# Altium schematic sheet Bank223.SchDoc: Bank223
size A3; Organization: Altium Limited; Address1: L3, 12a Rodborough Rd; Address2: Frenchs Forest; Address3: NSW; Address4: Australia 2086
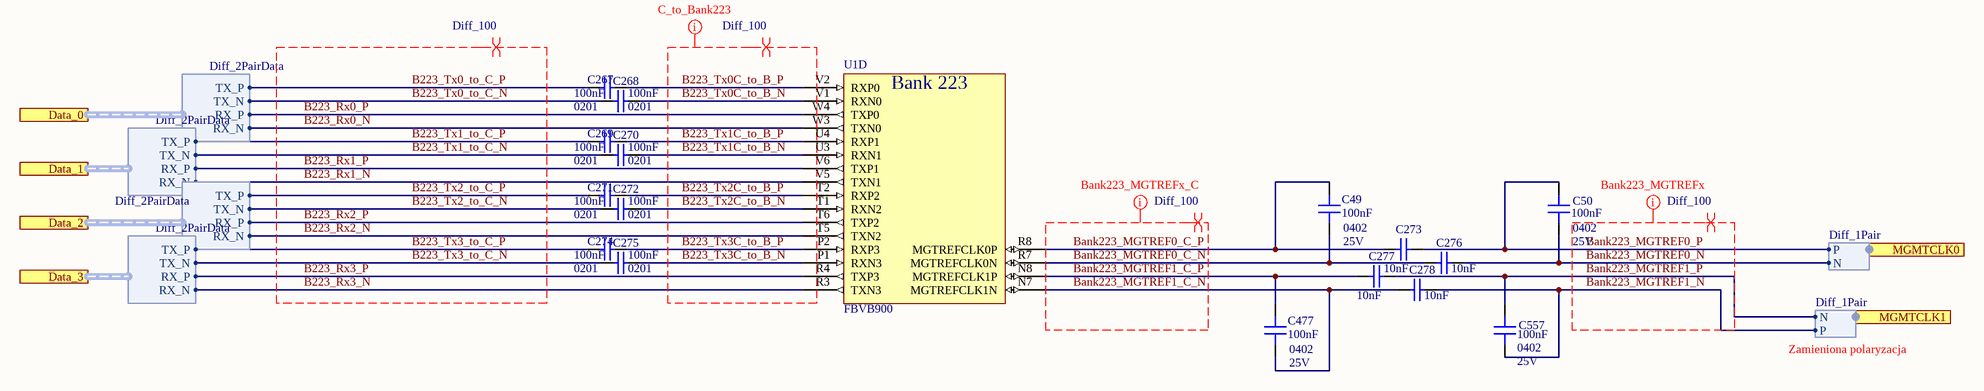
[diagram p0: Bank223.SchDoc]

## Parts
C49  100nF  Case/Package: 0402  Voltage Rating: 25V  [CAP 0402/1005 KK]
C50  100nF  Case/Package: 0402  Voltage Rating: 25V  [CAP 0402/1005 KK]
C267  100nF  Case/Package: 0201  [CAP 0201/0603 KK]
C268  100nF  Case/Package: 0201  [CAP 0201/0603 KK]
C269  100nF  Case/Package: 0201  [CAP 0201/0603 KK]
C270  100nF  Case/Package: 0201  [CAP 0201/0603 KK]
C271  100nF  Case/Package: 0201  [CAP 0201/0603 KK]
C272  100nF  Case/Package: 0201  [CAP 0201/0603 KK]
C273  10nF  [CAP 0201/0603 KK]
C274  100nF  Case/Package: 0201  [CAP 0201/0603 KK]
C275  100nF  Case/Package: 0201  [CAP 0201/0603 KK]
C276  10nF  [CAP 0201/0603 KK]
C277  10nF  [CAP 0201/0603 KK]
C278  10nF  [CAP 0201/0603 KK]
C477  100nF  Case/Package: 0402  Voltage Rating: 25V  [CAP 0402/1005 KK]
C557  100nF  Case/Package: 0402  Voltage Rating: 25V  [CAP 0402/1005 KK]
U1  FBVB900  [FBVB900 XX]  (part D of 23)

## Ports
Data_0 (harness Diff_2PairData), Data_1 (harness Diff_2PairData), Data_2 (harness Diff_2PairData), Data_3 (harness Diff_2PairData), MGMTCLK0 (harness Diff_1Pair), MGMTCLK1 (harness Diff_1Pair)

## Harnesses
Diff_1Pair: P, N
Diff_2PairData: RX_P, RX_N, TX_P, TX_N

## Nets
B223_Rx0_N: U1.W3(TXN0) ; port Data_0.RX_N
B223_Rx0_P: U1.W4(TXP0) ; port Data_0.RX_P
B223_Rx1_N: U1.V5(TXN1) ; port Data_1.RX_N
B223_Rx1_P: U1.V6(TXP1) ; port Data_1.RX_P
B223_Rx2_N: U1.T5(TXN2) ; port Data_2.RX_N
B223_Rx2_P: U1.T6(TXP2) ; port Data_2.RX_P
B223_Rx3_N: U1.R3(TXN3) ; port Data_3.RX_N
B223_Rx3_P: U1.R4(TXP3) ; port Data_3.RX_P
B223_Tx0_to_C_N: C268.1 ; port Data_0.TX_N
B223_Tx0_to_C_P: C267.1 ; port Data_0.TX_P
B223_Tx0C_to_B_N: C268.2 U1.V1(RXN0)
B223_Tx0C_to_B_P: C267.2 U1.V2(RXP0)
B223_Tx1_to_C_N: C270.1 ; port Data_1.TX_N
B223_Tx1_to_C_P: C269.1 ; port Data_1.TX_P
B223_Tx1C_to_B_N: C270.2 U1.U3(RXN1)
B223_Tx1C_to_B_P: C269.2 U1.U4(RXP1)
B223_Tx2_to_C_N: C272.1 ; port Data_2.TX_N
B223_Tx2_to_C_P: C271.1 ; port Data_2.TX_P
B223_Tx2C_to_B_N: C272.2 U1.T1(RXN2)
B223_Tx2C_to_B_P: C271.2 U1.T2(RXP2)
B223_Tx3_to_C_N: C275.1 ; port Data_3.TX_N
B223_Tx3_to_C_P: C274.1 ; port Data_3.TX_P
B223_Tx3C_to_B_N: C275.2 U1.P1(RXN3)
B223_Tx3C_to_B_P: C274.2 U1.P2(RXP3)
Bank223_MGTREF0_C_N: C49.1 C276.1 U1.R7(MGTREFCLK0N)
Bank223_MGTREF0_C_P: C49.2 C273.1 U1.R8(MGTREFCLK0P)
Bank223_MGTREF0_N: C50.1 C276.2 ; port MGMTCLK0.N
Bank223_MGTREF0_P: C50.2 C273.2 ; port MGMTCLK0.P
Bank223_MGTREF1_C_N: C278.1 C477.1 U1.N7(MGTREFCLK1N)
Bank223_MGTREF1_C_P: C277.1 C477.2 U1.N8(MGTREFCLK1P)
Bank223_MGTREF1_N: C278.2 C557.1 ; port MGMTCLK1.P
Bank223_MGTREF1_P: C277.2 C557.2 ; port MGMTCLK1.N

## Layout directives
differential pair; differential pair class Diff_100: B223_Rx0_N, B223_Rx0_P, B223_Rx1_N, B223_Rx1_P, B223_Rx2_N, B223_Rx2_P, B223_Rx3_N, B223_Rx3_P, B223_Tx0_to_C_N, B223_Tx0_to_C_P, B223_Tx0C_to_B_N, B223_Tx0C_to_B_P, B223_Tx1_to_C_N, B223_Tx1_to_C_P, B223_Tx1C_to_B_N, B223_Tx1C_to_B_P, B223_Tx2_to_C_N, B223_Tx2_to_C_P, B223_Tx2C_to_B_N, B223_Tx2C_to_B_P, B223_Tx3_to_C_N, B223_Tx3_to_C_P, B223_Tx3C_to_B_N, B223_Tx3C_to_B_P, Bank223_MGTREF0_C_N, Bank223_MGTREF0_C_P, Bank223_MGTREF0_N, Bank223_MGTREF0_P, Bank223_MGTREF1_C_N, Bank223_MGTREF1_C_P, Bank223_MGTREF1_N, Bank223_MGTREF1_P
net class C_to_Bank223: B223_Tx0C_to_B_N, B223_Tx0C_to_B_P, B223_Tx1C_to_B_N, B223_Tx1C_to_B_P, B223_Tx2C_to_B_N, B223_Tx2C_to_B_P, B223_Tx3C_to_B_N, B223_Tx3C_to_B_P
net class Bank223_MGTREFx_C: Bank223_MGTREF0_C_N, Bank223_MGTREF0_C_P, Bank223_MGTREF1_C_N, Bank223_MGTREF1_C_P
net class Bank223_MGTREFx: Bank223_MGTREF0_N, Bank223_MGTREF0_P, Bank223_MGTREF1_N, Bank223_MGTREF1_P

## Notes on the sheet
- Zamieniona polaryzacja
- Title
- Size:
- Date:
- A3
- Number:
- Time:
- Revision:
- Sheet
- of
- File:
- (in symbol FBVB900, part D) Bank 223

## Library data of the parts
C49 C50 C477 C557 = Capacitor: Manufacturer: Murata; Manufacturer Part Number: GRM155R71E104KE14J; Tolerance: 10%; Dielectric: X7R; Supplier 1: Digi-Key; Supplier Part Number 1: 490-14603-1-ND; Stock 1: 89275; Pricing 1: 1 = 0,10000, 10 = 0,03400, 100 = 0,01520, 500 = 0,01088, 1000 = 0,00855, 2500 = 0,00778, 5000 = 0,00715 (USD); RoHS: Yes; Mount: Surface Mount; Weight: 0.000212oz; Case Code (Imperial): 0402; Case Code (Metric): 1005; Min Operating Temperature: -55°C; Max Operating Temperature: 125°C; Packaging: Tape and Reel; Capacitance: 100nF; Termination: SMD/SMT; Composition: Ceramic; Voltage Rating (DC): 25V; Package Quantity: 50000; Length: 0.039inch; Height: 0.5mm; Width: 0.5mm; Thickness: 0.022inch; ComponentLink1URL: http://www.mouser.com/ds/2/281/c02e-2905.pdf?src-supplier=Mouser; ComponentLink1Description: http://www.mouser.com/ds/2/281/c02e-2905.pdf?src-supplier=Mouser; ComponentLink2URL: http://search.murata.co.jp/Ceramy/image/img/A01X/G101/ENG/GRM155R71E104KE14-01.pdf?src-supplier=Digi-Key; ComponentLink2Description: http://search.murata.co.jp/Ceramy/image/img/A01X/G101/ENG/GRM155R71E104KE14-01.pdf?src-supplier=Digi-Key
C267-C272 C274 C275 = Capacitor: CAP CER 0.1UF 16V X5R 0201; Manufacturer: Murata; Manufacturer Part Number: GRM033R61C104ME84D; Tolerance: 20%; Supplier 1: Digi-Key; Supplier Part Number 1: 490-9986-1-ND; RoHS: Yes; Category: Ceramic Capacitors; Stock 1: 519119; Pricing 1: 1=0,10000, 10=0,06000, 100=0,02670, 500=0,01906, 1000=0,01497, 2500=0,01361, 5000=0,01252 (USD); Mount: Surface Mount; Weight: 1.2E-05oz; Case Code (Metric): 0603; Min Operating Temperature: -55°C; Max Operating Temperature: 85°C; Capacitance: 100nF; Packaging: Tape and Reel; Voltage Rating: 16V; Dielectric: X5R; Termination: SMD/SMT; Voltage Rating (DC): 16V; Package Quantity: 15000; Length: 0.024inch; Height: 0.3mm; Width: 0.3mm; Thickness: 0.013inch; ComponentLink1URL: http://www.mouser.com/ds/2/281/c02e-2905.pdf?src-supplier=Mouser; ComponentLink1Description: http://www.mouser.com/ds/2/281/c02e-2905.pdf?src-supplier=Mouser; ComponentLink2URL: http://search.murata.co.jp/Ceramy/image/img/A01X/G101/ENG/GRM033R61C104ME84-01.pdf?src-supplier=Digi-Key; ComponentLink2Description: http://search.murata.co.jp/Ceramy/image/img/A01X/G101/ENG/GRM033R61C104ME84-01.pdf?src-supplier=Digi-Key
  C268 C270 C272 C275: Case Code (Imperial): 0201
C273 C276-C278 = Capacitor: CAP CER 10000PF 16V X7R 0201; Manufacturer: Murata; Manufacturer Part Number: GRM033R71C103KE14D; Tolerance: 10%; Supplier 1: Digi-Key; Supplier Part Number 1: 490-14453-1-ND; RoHS: No; Category: Ceramic Capacitors; Stock 1: 188777; Pricing 1: 1=0,10000, 10=0,01900, 100=0,00870, 500=0,00620, 1000=0,00487, 2500=0,00443, 5000=0,00407 (USD); Voltage Rating (DC): 16V; Dielectric: X7R; Capacitance: 10nF; Length: 600um; Width: 300um; Thickness: 300um; ComponentLink1URL: http://www.farnell.com/datasheets/2722745.pdf?src-supplier=Farnell; ComponentLink1Description: http://www.farnell.com/datasheets/2722745.pdf?src-supplier=Farnell; ComponentLink2URL: http://www.farnell.com/datasheets/2722745.pdf?src-supplier=Newark; ComponentLink2Description: http://www.farnell.com/datasheets/2722745.pdf?src-supplier=Newark; ComponentLink3URL: http://www.farnell.com/datasheets/2722745.pdf?src-supplier=Element14; ComponentLink3Description: http://www.farnell.com/datasheets/2722745.pdf?src-supplier=Element14; ComponentLink4URL: http://search.murata.co.jp/Ceramy/image/img/A01X/G101/ENG/GRM033R71C103KE14-01.pdf?src-supplier=Digi-Key; ComponentLink4Description: http://search.murata.co.jp/Ceramy/image/img/A01X/G101/ENG/GRM033R71C103KE14-01.pdf?src-supplier=Digi-Key
U1 = FBVB900: FPGA Zynq UltraScale+ Family 192150 Cells 20nm Technology 0.85V 900-Pin FCBGA Tray; Manufacturer Part Number: XCZU4CG-1FBVB900E; Manufacturer: Xilinx; Peripherals: WDT,DMA; Interface: I2C,SPI,USB,Ethernet,MMC,SDIO,SD,UART,USART,EBI/EMI; Core Architecture: ARM; RAM Size: 256KB; Frequency: 500MHz; Number of I/Os: 204; Supplier 1: Mouser; Supplier Part Number 1: 217-CZU4CG-1FBVB900E; Stock 1: 3; Pricing 1: 1=0,00000, 5=1060,70000 (USD); RoHS: No; Case/Package: FCBGA; Min Operating Temperature: 0°C; Max Operating Temperature: 100°C; Packaging: Tray; ComponentLink1URL: https://www.xilinx.com/support/documentation/data_sheets/ds891-zynq-ultrascale-plus-overview.pdf?src-supplier=Digi-Key; ComponentLink1Description: https://www.xilinx.com/support/documentation/data_sheets/ds891-zynq-ultrascale-plus-overview.pdf?src-supplier=Digi-Key; ComponentLink2URL: https://www.xilinx.com/support/documentation/data_sheets/ds925-zynq-ultrascale-plus.pdf?src-supplier=Digi-Key; ComponentLink2Description: https://www.xilinx.com/support/documentation/data_sheets/ds925-zynq-ultrascale-plus.pdf?src-supplier=Digi-Key; Supplier 2: Avnet; Supplier 3: Digi-Key; Supplier Part Number 2: XCZU4CG-1FBVB900E; Supplier Part Number 3: XCZU4CG-1FBVB900E-ND